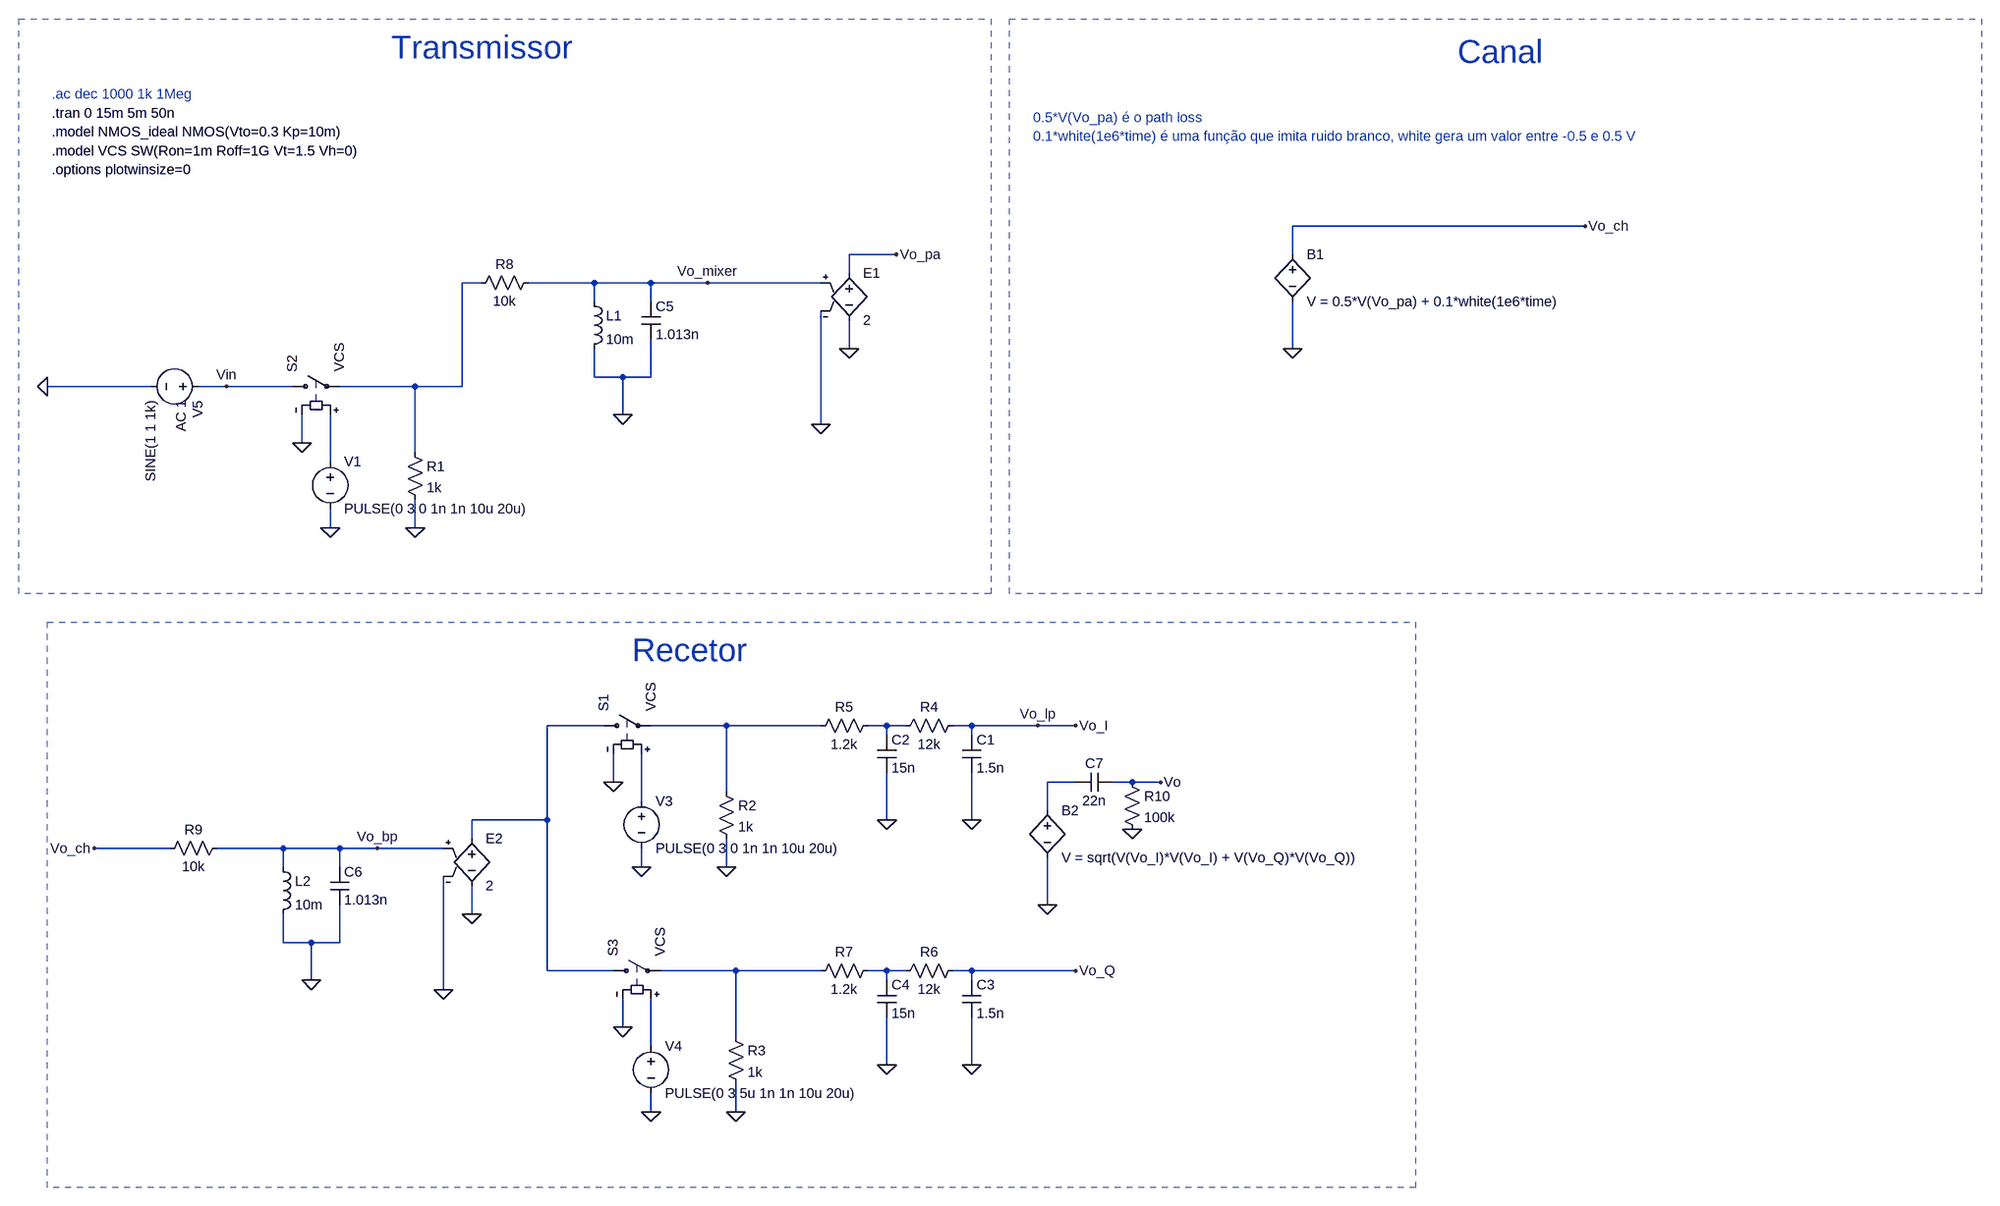
[diagram p0: schematic teste_lab1_t.asc]
teste_lab1_t.asc, the LTspice schematic file:
Version 4.1
SHEET 1 3188 1460
WIRE 2512 -176 2016 -176
WIRE 1344 -128 1264 -128
WIRE 2016 -128 2016 -176
WIRE 1264 -96 1264 -128
WIRE 640 -80 608 -80
WIRE 832 -80 720 -80
WIRE 928 -80 832 -80
WIRE 1024 -80 928 -80
WIRE 1216 -80 1024 -80
WIRE 832 -48 832 -80
WIRE 928 -48 928 -80
WIRE 1264 32 1264 -16
WIRE 2016 32 2016 -48
WIRE 832 80 832 32
WIRE 880 80 832 80
WIRE 928 80 928 16
WIRE 928 80 880 80
WIRE 80 96 -96 96
WIRE 208 96 160 96
WIRE 320 96 208 96
WIRE 528 96 400 96
WIRE 608 96 608 -80
WIRE 608 96 528 96
WIRE 880 144 880 80
WIRE 1216 160 1216 -32
WIRE 336 192 336 144
WIRE 528 208 528 96
WIRE 384 224 384 144
WIRE 384 336 384 304
WIRE 528 336 528 288
WIRE 848 672 752 672
WIRE 1056 672 928 672
WIRE 1216 672 1056 672
WIRE 1328 672 1296 672
WIRE 1360 672 1328 672
WIRE 1472 672 1440 672
WIRE 1584 672 1472 672
WIRE 1648 672 1584 672
WIRE 1328 688 1328 672
WIRE 1472 688 1472 672
WIRE 864 768 864 720
WIRE 1648 768 1600 768
WIRE 1744 768 1712 768
WIRE 1792 768 1744 768
WIRE 1056 784 1056 672
WIRE 912 800 912 720
WIRE 1600 816 1600 768
WIRE 752 832 752 672
WIRE 752 832 624 832
WIRE 1328 832 1328 752
WIRE 1472 832 1472 752
WIRE 624 864 624 832
WIRE 112 880 -16 880
WIRE 304 880 192 880
WIRE 400 880 304 880
WIRE 464 880 400 880
WIRE 576 880 464 880
WIRE 304 912 304 880
WIRE 400 912 400 880
WIRE 912 912 912 880
WIRE 1056 912 1056 864
WIRE 1600 976 1600 896
WIRE 624 992 624 944
WIRE 304 1040 304 992
WIRE 352 1040 304 1040
WIRE 400 1040 400 976
WIRE 400 1040 352 1040
WIRE 752 1088 752 832
WIRE 864 1088 752 1088
WIRE 1072 1088 944 1088
WIRE 1216 1088 1072 1088
WIRE 1328 1088 1296 1088
WIRE 1360 1088 1328 1088
WIRE 1472 1088 1440 1088
WIRE 1648 1088 1472 1088
WIRE 352 1104 352 1040
WIRE 1328 1104 1328 1088
WIRE 1472 1104 1472 1088
WIRE 576 1120 576 928
WIRE 880 1184 880 1136
WIRE 1072 1200 1072 1088
WIRE 928 1216 928 1136
WIRE 1328 1248 1328 1168
WIRE 1472 1248 1472 1168
WIRE 928 1328 928 1296
WIRE 1072 1328 1072 1280
FLAG -96 96 0
FLAG 528 336 0
FLAG 384 336 0
FLAG 336 192 0
FLAG 1024 -80 Vo_mixer
FLAG 2016 32 0
FLAG 2512 -176 Vo_ch
FLAG 1344 -128 Vo_pa
FLAG 1216 160 0
FLAG -16 880 Vo_ch
FLAG 576 1120 0
FLAG 624 992 0
FLAG 1264 32 0
FLAG 1056 912 0
FLAG 912 912 0
FLAG 864 768 0
FLAG 1072 1328 0
FLAG 928 1328 0
FLAG 880 1184 0
FLAG 1472 832 0
FLAG 1328 832 0
FLAG 1472 1248 0
FLAG 1328 1248 0
FLAG 1648 672 Vo_I
FLAG 1648 1088 Vo_Q
FLAG 1600 976 0
FLAG 1792 768 Vo
FLAG 208 96 Vin
FLAG 880 144 0
FLAG 352 1104 0
FLAG 1584 672 Vo_lp
FLAG 464 880 Vo_bp
FLAG 1744 848 0
SYMBOL res 512 192 R0
SYMATTR InstName R1
SYMATTR Value 1k
SYMBOL sw 304 96 R270
SYMATTR InstName S2
SYMATTR Value VCS
SYMBOL bv 2016 -144 R0
SYMATTR InstName B1
SYMATTR Value V = 0.5*V(Vo_pa) + 0.1*white(1e6*time)
SYMBOL e 1264 -112 R0
SYMATTR InstName E1
SYMATTR Value 2
SYMBOL e 624 848 R0
SYMATTR InstName E2
SYMATTR Value 2
SYMBOL res 1040 768 R0
SYMATTR InstName R2
SYMATTR Value 1k
SYMBOL voltage 912 784 R0
WINDOW 123 0 0 Left 0
WINDOW 39 0 0 Left 0
SYMATTR InstName V3
SYMATTR Value PULSE(0 3 0 1n 1n 10u 20u)
SYMBOL sw 832 672 R270
SYMATTR InstName S1
SYMATTR Value VCS
SYMBOL res 1056 1184 R0
SYMATTR InstName R3
SYMATTR Value 1k
SYMBOL voltage 928 1200 R0
WINDOW 123 0 0 Left 0
WINDOW 39 0 0 Left 0
SYMATTR InstName V4
SYMATTR Value PULSE(0 3 5u 1n 1n 10u 20u)
SYMBOL sw 848 1088 R270
SYMATTR InstName S3
SYMATTR Value VCS
SYMBOL cap 1456 688 R0
SYMATTR InstName C1
SYMATTR Value 1.5n
SYMBOL cap 1312 688 R0
SYMATTR InstName C2
SYMATTR Value 15n
SYMBOL res 1456 656 R90
WINDOW 0 0 56 VBottom 2
WINDOW 3 32 56 VTop 2
SYMATTR InstName R4
SYMATTR Value 12k
SYMBOL res 1312 656 R90
WINDOW 0 0 56 VBottom 2
WINDOW 3 32 56 VTop 2
SYMATTR InstName R5
SYMATTR Value 1.2k
SYMBOL cap 1456 1104 R0
SYMATTR InstName C3
SYMATTR Value 1.5n
SYMBOL cap 1312 1104 R0
SYMATTR InstName C4
SYMATTR Value 15n
SYMBOL res 1456 1072 R90
WINDOW 0 0 56 VBottom 2
WINDOW 3 32 56 VTop 2
SYMATTR InstName R6
SYMATTR Value 12k
SYMBOL res 1312 1072 R90
WINDOW 0 0 56 VBottom 2
WINDOW 3 32 56 VTop 2
SYMATTR InstName R7
SYMATTR Value 1.2k
SYMBOL bv 1600 800 R0
SYMATTR InstName B2
SYMATTR Value V = sqrt(V(Vo_I)*V(Vo_I) + V(Vo_Q)*V(Vo_Q))
SYMBOL res 736 -96 R90
WINDOW 0 0 56 VBottom 2
WINDOW 3 32 56 VTop 2
SYMATTR InstName R8
SYMATTR Value 10k
SYMBOL ind 816 -64 R0
SYMATTR InstName L1
SYMATTR Value 10m
SYMBOL cap 912 -48 R0
SYMATTR InstName C5
SYMATTR Value 1.013n
SYMBOL voltage 176 96 R90
WINDOW 123 24 44 Left 2
WINDOW 39 0 0 Left 0
SYMATTR Value2 AC 1
SYMATTR InstName V5
SYMATTR Value SINE(1 1 1k)
SYMBOL voltage 384 208 R0
WINDOW 123 24 44 Left 2
WINDOW 39 0 0 Left 0
SYMATTR InstName V1
SYMATTR Value PULSE(0 3 0 1n 1n 10u 20u)
SYMBOL res 208 864 R90
WINDOW 0 0 56 VBottom 2
WINDOW 3 32 56 VTop 2
SYMATTR InstName R9
SYMATTR Value 10k
SYMBOL ind 288 896 R0
SYMATTR InstName L2
SYMATTR Value 10m
SYMBOL cap 384 912 R0
SYMATTR InstName C6
SYMATTR Value 1.013n
SYMBOL cap 1712 752 R90
WINDOW 0 0 32 VBottom 2
WINDOW 3 32 32 VTop 2
SYMATTR InstName C7
SYMATTR Value 22n
SYMBOL res 1728 752 R0
SYMATTR InstName R10
SYMATTR Value 100k
TEXT -88 -368 Left 2 !.tran 0 15m 5m 50n
TEXT -88 -304 Left 2 !.model VCS SW(Ron=1m Roff=1G Vt=1.5 Vh=0)
TEXT -88 -336 Left 2 !.model NMOS_ideal NMOS(Vto=0.3 Kp=10m)
TEXT 488 -480 Left 5 ;Transmissor
TEXT 2296 -472 Left 5 ;Canal
TEXT 896 544 Left 5 ;Recetor
TEXT -88 -272 Left 2 !.options plotwinsize=0
TEXT 1576 -360 Left 2 ;0.5*V(Vo_pa) é o path loss\n0.1*white(1e6*time) é uma função que imita ruido branco, white gera um valor entre -0.5 e 0.5 V
TEXT -88 -400 Left 2 ;.ac dec 1000 1k 1Meg
RECTANGLE Normal 1504 448 -144 -528 2
RECTANGLE Normal 3184 448 1536 -528 2
RECTANGLE Normal 2224 1456 -96 496 2

The netlist it stands for:
* teste_lab1_t.asc
R1 N001 0 1k
S2 Vin N001 N002 0 VCS
B1 Vo_ch 0 V = 0.5*V(Vo_pa) + 0.1*white(1e6*time)
E1 Vo_pa 0 Vo_mixer 0 2
E2 N003 0 Vo_bp 0 2
R2 N004 0 1k
V3 N007 0 PULSE(0 3 0 1n 1n 10u 20u)
S1 N003 N004 N007 0 VCS
R3 N008 0 1k
V4 N010 0 PULSE(0 3 5u 1n 1n 10u 20u)
S3 N003 N008 N010 0 VCS
C1 Vo_lp 0 1.5n
C2 N005 0 15n
R4 Vo_lp N005 12k
R5 N005 N004 1.2k
C3 Vo_Q 0 1.5n
C4 N009 0 15n
R6 Vo_Q N009 12k
R7 N009 N008 1.2k
B2 N006 0 V = sqrt(V(Vo_I)*V(Vo_I) + V(Vo_Q)*V(Vo_Q))
R8 Vo_mixer N001 10k
L1 Vo_mixer 0 10m
C5 Vo_mixer 0 1.013n
V5 Vin 0 SINE(1 1 1k) AC 1
V1 N002 0 PULSE(0 3 0 1n 1n 10u 20u)
R9 Vo_bp Vo_ch 10k
L2 Vo_bp 0 10m
C6 Vo_bp 0 1.013n
C7 Vo N006 22n
R10 Vo 0 100k
.tran 0 15m 5m 50n
.model VCS SW(Ron=1m Roff=1G Vt=1.5 Vh=0)
.model NMOS_ideal NMOS(Vto=0.3 Kp=10m)
* Transmissor
* Canal
* Recetor
.options plotwinsize=0
* 0.5*V(Vo_pa) é o path loss
* 0.1*white(1e6*time) é uma função que imita ruido branco, white gera um valor entre -0.5 e 0.5 V
* .ac dec 1000 1k 1Meg
.backanno
.end